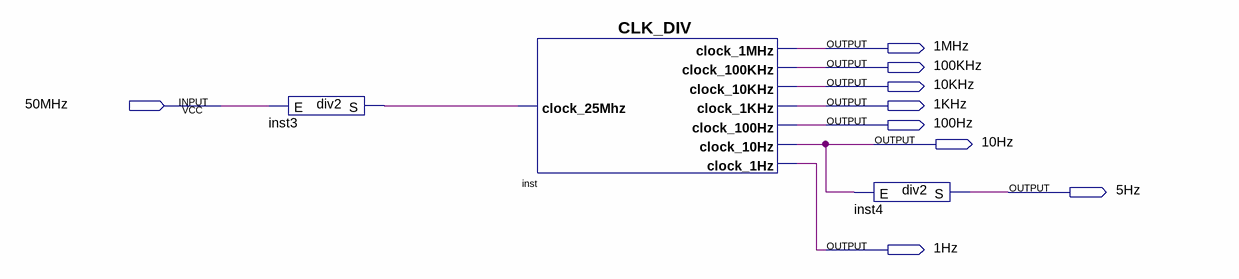
[diagram p0: schematic sheet]
// Quartus schematic Clock_Div.bdf as structural Verilog: 3 symbols, 9 pins
module Clock_Div (
  input  \50MHz ,
  output \1MHz ,
  output \100KHz ,
  output \10KHz ,
  output \1KHz ,
  output \100Hz ,
  output \10Hz ,
  output \5Hz ,
  output \1Hz 
);

  wire inst3_s;

  div2 inst3 (.E(\50MHz ), .S(inst3_s));
  CLK_DIV inst (
    .clock_25Mhz(inst3_s), .clock_1MHz(\1MHz ), .clock_100KHz(\100KHz ), .clock_10KHz(\10KHz ),
    .clock_1KHz(\1KHz ), .clock_100Hz(\100Hz ), .clock_10Hz(\10Hz ), .clock_1Hz(\1Hz ));
  div2 inst4 (.E(\10Hz ), .S(\5Hz ));
endmodule
